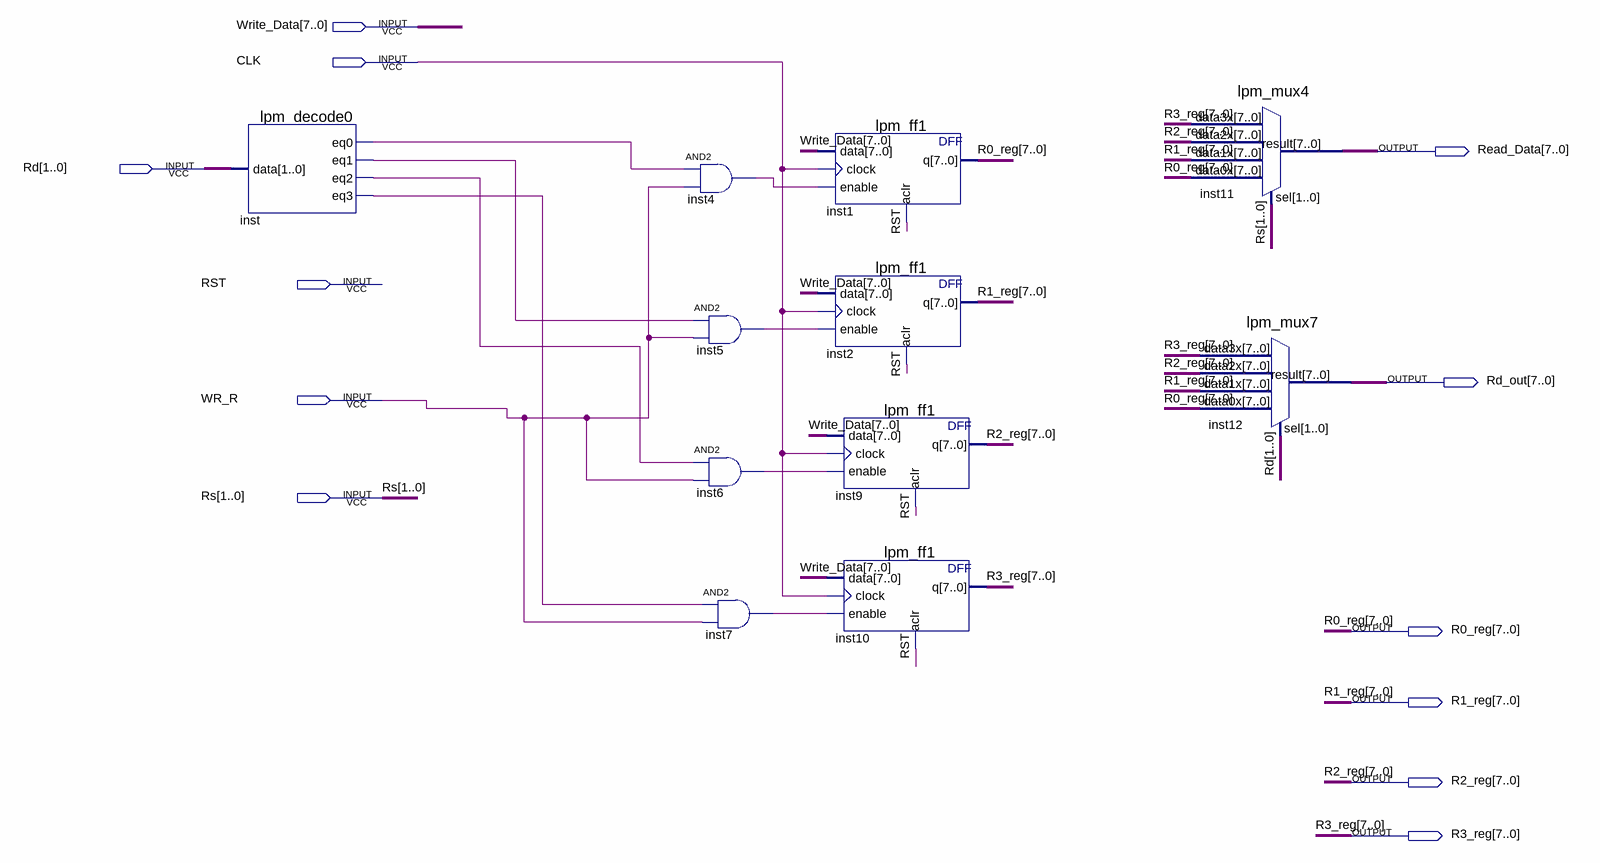
[diagram p0: schematic sheet]
// Quartus schematic Register_cpu_demo.bdf as structural Verilog: 11 symbols, 12 pins
module Register_cpu_demo (
  input  [7:0] Write_Data,
  input  CLK,
  input  [1:0] Rd,
  input  RST,
  input  WR_R,
  input  [1:0] Rs,
  output [7:0] Read_Data,
  output [7:0] Rd_out,
  output [7:0] R0_reg,
  output [7:0] R1_reg,
  output [7:0] R2_reg,
  output [7:0] R3_reg
);

  wire inst4_out, inst5_out, inst6_out, inst7_out, inst_eq0, inst_eq1, inst_eq2, inst_eq3;

  lpm_decode0 inst (.data(Rd), .eq0(inst_eq0), .eq1(inst_eq1), .eq2(inst_eq2), .eq3(inst_eq3));
  and inst4 (inst4_out, inst_eq0, WR_R);
  and inst5 (inst5_out, inst_eq1, WR_R);
  and inst6 (inst6_out, inst_eq2, WR_R);
  and inst7 (inst7_out, inst_eq3, WR_R);
  lpm_ff1 inst1 (.data(Write_Data), .clock(CLK), .enable(inst4_out), .aclr(RST), .q(R0_reg));
  lpm_ff1 inst2 (.data(Write_Data), .clock(CLK), .enable(inst5_out), .aclr(RST), .q(R1_reg));
  lpm_ff1 inst9 (.data(Write_Data), .clock(CLK), .enable(inst6_out), .aclr(RST), .q(R2_reg));
  lpm_ff1 inst10 (.data(Write_Data), .clock(CLK), .enable(inst7_out), .aclr(RST), .q(R3_reg));
  lpm_mux4 inst11 (.data3x(R3_reg), .data2x(R2_reg), .data1x(R1_reg), .data0x(R0_reg), .sel(Rs), .result(Read_Data));
  lpm_mux7 inst12 (.data3x(R3_reg), .data2x(R2_reg), .data1x(R1_reg), .data0x(R0_reg), .sel(Rd), .result(Rd_out));
endmodule
